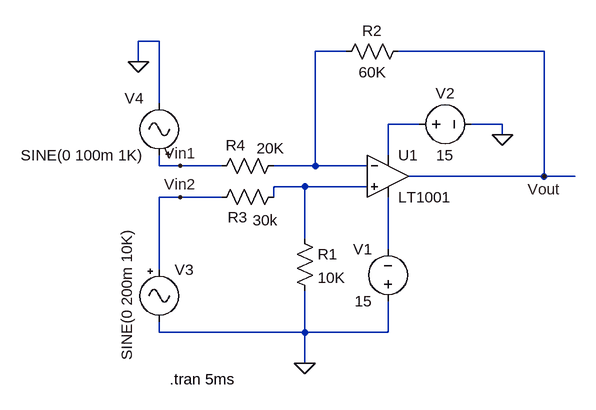
[diagram p0: schematic EXP4.4.asc]
EXP4.4.asc, the LTspice schematic file:
Version 4
SHEET 1 896 680
WIRE -160 32 -192 32
WIRE 128 48 80 48
WIRE 432 48 208 48
WIRE -192 64 -192 32
WIRE -160 128 -160 32
WIRE 240 160 192 160
WIRE 368 160 320 160
WIRE 368 176 368 160
WIRE 192 208 192 160
WIRE -160 224 -160 208
WIRE -128 224 -160 224
WIRE -64 224 -128 224
WIRE 80 224 80 48
WIRE 80 224 16 224
WIRE 160 224 80 224
WIRE 432 240 432 48
WIRE 432 240 224 240
WIRE 480 240 432 240
WIRE 64 256 16 256
WIRE 160 256 64 256
WIRE -128 272 -160 272
WIRE -64 272 -128 272
WIRE 16 272 16 256
WIRE 64 336 64 256
WIRE 192 352 192 272
WIRE -160 384 -160 272
WIRE -160 480 -160 464
WIRE 64 480 64 416
WIRE 64 480 -160 480
WIRE 192 480 192 432
WIRE 192 480 64 480
WIRE 64 528 64 480
FLAG 64 528 0
FLAG 368 176 0
FLAG 432 240 Vout
FLAG -192 64 0
FLAG -128 272 Vin2
FLAG -128 224 Vin1
SYMBOL voltage 192 448 R180
WINDOW 0 24 96 Left 2
WINDOW 3 24 16 Left 2
SYMATTR InstName V1
SYMATTR Value 15
SYMBOL opamps\\LT1001 192 176 R0
SYMATTR InstName U1
SYMBOL voltage 224 160 R270
WINDOW 0 32 56 VTop 2
WINDOW 3 -32 56 VBottom 2
SYMATTR InstName V2
SYMATTR Value 15
SYMBOL res 224 32 R90
WINDOW 0 0 56 VBottom 2
WINDOW 3 32 56 VTop 2
SYMATTR InstName R2
SYMATTR Value 60K
SYMBOL Misc\\signal -160 368 R0
WINDOW 3 -50 155 VLeft 2
SYMATTR Value SINE(0 200m 10K)
SYMATTR InstName V3
SYMBOL res 32 256 R90
WINDOW 0 63 71 VBottom 2
WINDOW 3 36 29 VTop 2
SYMATTR InstName R3
SYMATTR Value 30k
SYMBOL res 32 208 R90
WINDOW 0 0 74 VBottom 2
WINDOW 3 -27 21 VTop 2
SYMATTR InstName R4
SYMATTR Value 20K
SYMBOL Misc\\signal -160 224 R180
WINDOW 0 24 104 Left 2
WINDOW 3 24 16 Left 2
SYMATTR InstName V4
SYMATTR Value SINE(0 100m 1K)
SYMBOL res 48 320 R0
SYMATTR InstName R1
SYMATTR Value 10K
TEXT -144 552 Left 2 !.tran 5ms

The netlist it stands for:
* EXP4.4.asc
V1 0 N004 15
XU1 N003 N001 N002 N004 Vout LT1001  ; pins In+ In- V+ V- OUT
V2 N002 0 15
R2 Vout N001 60K
V3 Vin2 0 SINE(0 200m 10K)
R3 N003 Vin2 30k
R4 N001 Vin1 20K
V4 Vin1 0 SINE(0 100m 1K)
R1 N003 0 10K
.tran 5ms
.lib LTC.lib
.backanno
.end